# EasyEDA Pro project Switch_Robot_Carrier_V05.epro

# Schematic Schematic1
Assembly Variant: Basic; Board Name: Board1; Create Date: 2026-11-12; Page Name: P1; Project Name: Switch Robot Carrier V0.5; Schematic Name: Schematic1; Update Date: 2026-11-12; Company: 嘉立创EDA; Page Size: A4; Version: V1.0
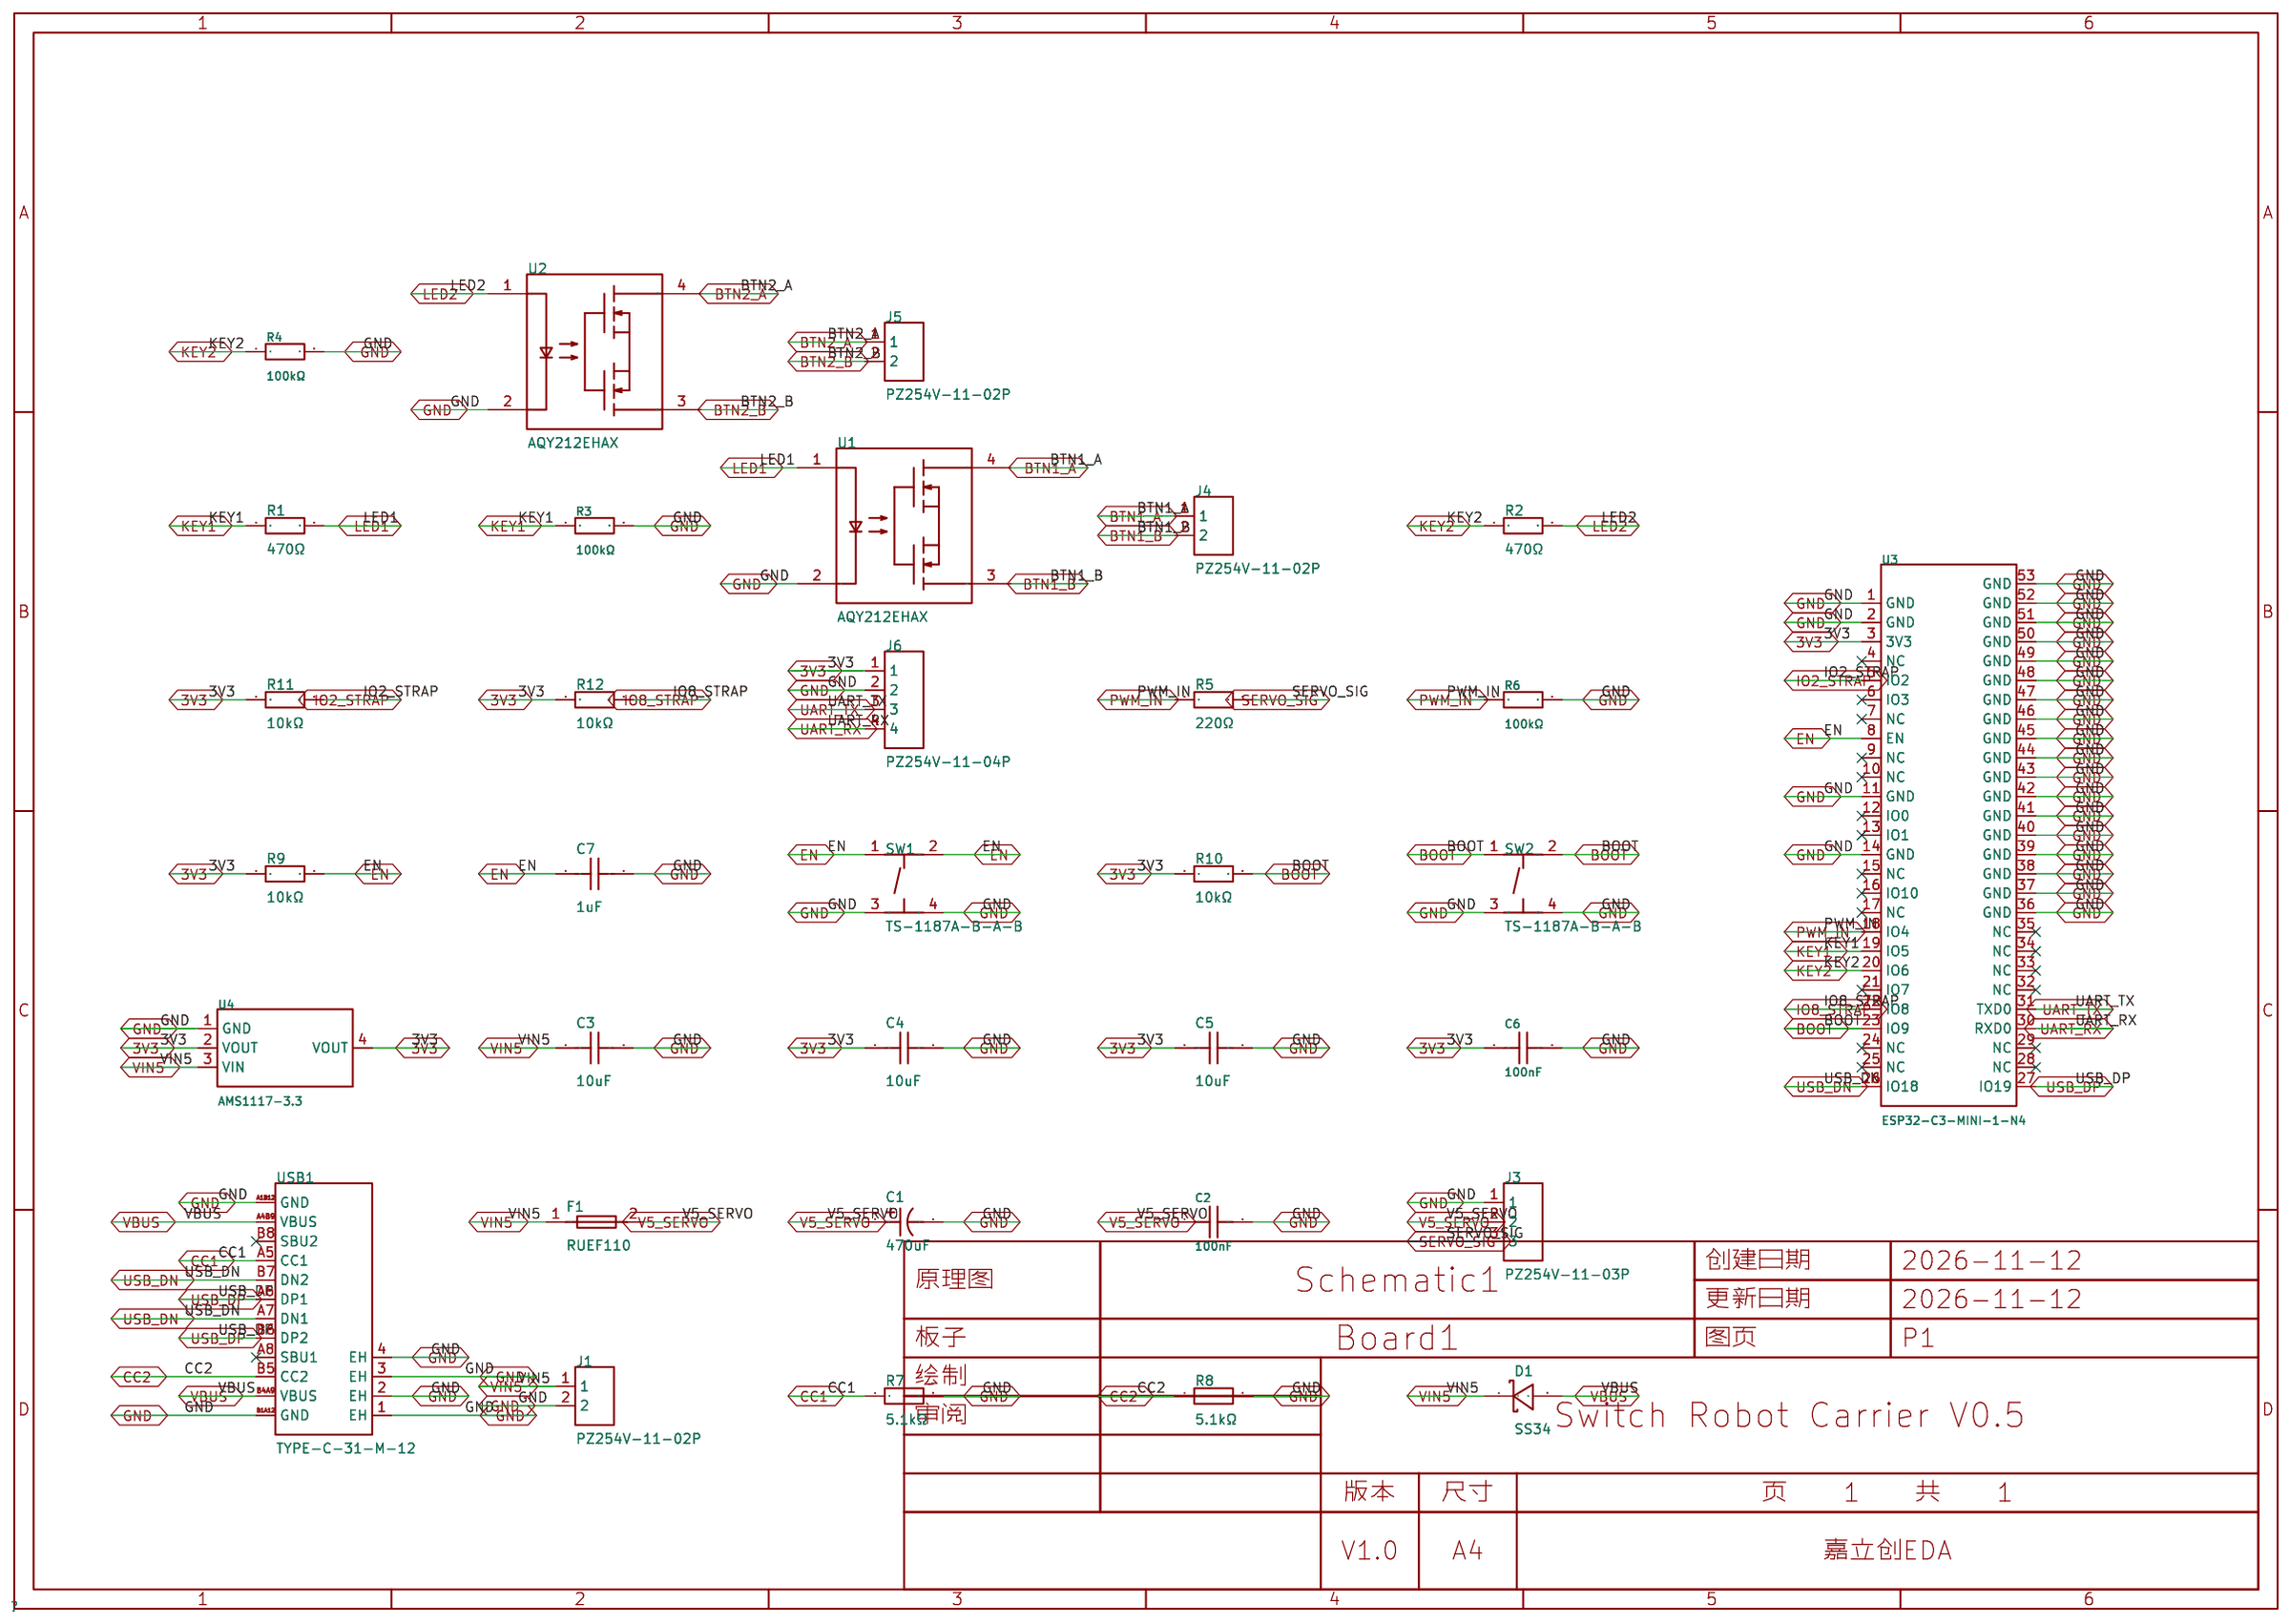
[diagram p0: schematic sheet]

## Parts
C1  470uF  [CAP-TH_BD10.0-P5.00-D0.6-FD]
C2  100nF  [C0603]
C3  10uF  [C0805]
C4  10uF  [C0805]
C5  10uF  [C0805]
C6  100nF  [C0603]
C7  1uF  [C0603]
D1  SS34  [SMA_L4.3-W2.6-LS5.2-RD]
F1  RUEF110  [FUSE-TH_L7.0-W3.1-P5.08-D1.2]
J1  PZ254V-11-02P  [HDR-TH_2P-P2.54-V-M]
J3  PZ254V-11-03P  [HDR-TH_3P-P2.54-V-M_PZ254V-11-03P]
J4  PZ254V-11-02P  [HDR-TH_2P-P2.54-V-M]
J5  PZ254V-11-02P  [HDR-TH_2P-P2.54-V-M]
J6  PZ254V-11-04P  [HDR-TH_4P-P2.54-V-M]
R1  470Ω  [R0603]
R2  470Ω  [R0603]
R3  100kΩ  [R0603]
R4  100kΩ  [R0603]
R5  220Ω  [R0603]
R6  100kΩ  [R0603]
R7  5.1kΩ  [R0603]
R8  5.1kΩ  [R0603]
R9  10kΩ  [R0603]
R10  10kΩ  [R0603]
R11  10kΩ  [R0603]
R12  10kΩ  [R0603]
SW1  TS-1187A-B-A-B  [SW-SMD_4P-L5.1-W5.1-P3.70-LS6.5-TL_H1.5]
SW2  TS-1187A-B-A-B  [SW-SMD_4P-L5.1-W5.1-P3.70-LS6.5-TL_H1.5]
U1  AQY212EHAX  [SOP-4_L6.5-W4.6-P2.54-LS10.2-TR]
U2  AQY212EHAX  [SOP-4_L6.5-W4.6-P2.54-LS10.2-TR]
U3  ESP32-C3-MINI-1-N4  [WIFIM-SMD_ESP32-C3-MINI-1]
U4  AMS1117-3.3  [SOT-223-3_L6.5-W3.4-P2.30-LS7.0-BR]
USB1  TYPE-C-31-M-12  [USB-C_SMD-TYPE-C-31-M-12_1]

## Library data of the parts
C1 = EEUFR1E471B: 容值:470uF;精度:±20%;额定电压:25V;纹波电流:967.5mA@120Hz;等效串联电阻(ESR):-;; LCSC Part Name: 470uF ±20% 25V; Supplier Part: C713400; Manufacturer: PANASONIC(松下); Supplier Footprint: 插件,D10xL12.5mm; JLCPCB Part Class: Extended Part; Datasheet: https://item.szlcsc.com/datasheet/EEUFR1E471B/753608.html; Supplier: LCSC; Tolerance: ±20%; Voltage Rating: 25V; Ripple Current: 967.5mA@120Hz; Pin Spacing: 5mm; Diameter: 10mm; Height - Seated (Max): 14mm; Lifetime: 6000hrs@105℃; Operating Temperature: -40℃~+105℃; Polarity type: 有极性; PCB Layer: Default
C2 C6 = CC0603KRX7R9BB104: 容值:100nF;精度:±10%;额定电压:50V;温度系数:X7R;; LCSC Part Name: 100nF ±10% 50V; Supplier Part: C14663; Manufacturer: YAGEO(国巨); Supplier Footprint: 0603; JLCPCB Part Class: Basic Part; Datasheet: https://item.szlcsc.com/datasheet/CC0603KRX7R9BB104/15331.html; Supplier: LCSC; Tolerance: ±10%; Voltage Rating: 50V; Temperature Coefficient: X7R; PCB Layer: Default
C3-C5 = CL21A106KAYNNNE_C15850: 容值:10uF;精度:±10%;额定电压:25V;温度系数:X5R;; LCSC Part Name: 10uF ±10% 25V; Supplier Part: C15850; Manufacturer: SAMSUNG(三星); Manufacturer Part: CL21A106KAYNNNE; Supplier Footprint: 0805; JLCPCB Part Class: Basic Part; Datasheet: https://item.szlcsc.com/datasheet/CL21A106KAYNNNE/16532.html; Supplier: LCSC; Tolerance: ±10%; Voltage Rating: 25V; Temperature Coefficient: X5R; PCB Layer: Default
C7 = CL10A105KB8NNNC: 容值:1uF;精度:±10%;额定电压:50V;温度系数:X5R;; LCSC Part Name: 1uF ±10% 50V; Supplier Part: C15849; Manufacturer: SAMSUNG(三星); Supplier Footprint: 0603; JLCPCB Part Class: Basic Part; Datasheet: https://item.szlcsc.com/datasheet/CL10A105KB8NNNC/16531.html; Supplier: LCSC; Tolerance: ±10%; Voltage Rating: 50V; Temperature Coefficient: X5R; PCB Layer: Default
D1 = SS34_C8678: 二极管配置:独立式;正向压降(Vf):550mV@3A;直流反向耐压(Vr):40V;整流电流:3A;; LCSC Part Name: 电压:40V 电流:3A; Supplier Part: C8678; Manufacturer: MDD(辰达半导体); Supplier Footprint: SMA(DO-214AC); JLCPCB Part Class: Basic Part; Datasheet: https://item.szlcsc.com/datasheet/SS34/9178.html; Supplier: LCSC; Diode Configuration: 独立式; Voltage - Forward(Vf@If): 550mV@3A; Voltage - DC Reverse(Vr): 40V; Current - Rectified: 3A; Reverse Leakage Current (Ir): 500uA@40V; Operating Junction Temperature Range: -55℃~+125℃; Non-Repetitive Peak Forward Surge Current: 80A; PCB Layer: Default
F1 = RUEF110: 耐压(Vmax):30V;最大电流(Imax):100A;保持电流(Ihold):1.1A;跳闸电流(Itrip):2.2A;; LCSC Part Name: 30V 1.1A 插件自恢复; Supplier Part: C5395; Manufacturer: Littelfuse(美国力特); Supplier Footprint: 插件,P=5.08mm; JLCPCB Part Class: Extended Part; Datasheet: https://item.szlcsc.com/datasheet/RUEF110/5832.html; Supplier: LCSC; Voltage - Max: 30V; Current - Max: 100A; Hold Current: 1.1A; Trip Current: 2.2A; Power Dissipation: 1.17W; Resistance - Initial (Ri) (Min): 70mΩ; Resistance - Post Trip (R1) (Max): 170mΩ; Time to Trip(Max): 6.6s; PCB Layer: Default
J1 J4 J5 = PZ254V-11-02P: 插针结构:1x2P;间距:2.54mm;行距:-;圆针/方针:方针;安装方式:直插;排数:单排;总PIN位数:2P;额定电流:3A;额定电压:250V;配合针长度:6.1mm;塑高:2.5mm;端接针长度:3mm;触头材质:黄铜;触头镀层:金;工作温度:-40℃~+105℃;颜色:黑色;; LCSC Part Name: 1x2P 间距:2.54mm 方针 直插; Supplier Part: C492401; Manufacturer: XFCN(兴飞); Supplier Footprint: 插件,P=2.54mm; JLCPCB Part Class: Extended Part; Datasheet: https://item.szlcsc.com/datasheet/PZ254V-11-02P/502957.html; Supplier: LCSC; Pin Structure: 1x2P; Pitch: 2.54mm; Circluar Pins/Square Pins: 方针; Mounting Type: 直插; Number of Rows: 单排; Number of Pins: 2P; Current Rating: 3A; Voltage Rating (Max): 250V; Length of Mating Pin: 6.1mm; Insulation Height: 2.5mm; Length of End Connection Pin: 3mm; Contact Material: 黄铜; Contact Plating: 金; Operating Temperature: -40℃~+105℃; Color: 黑色; PCB Layer: Default
J3 = PZ254V-11-03P: 插针结构:1x3P;间距:2.54mm;行距:-;圆针/方针:方针;安装方式:直插;排数:单排;总PIN位数:3P;额定电流:3A;额定电压:250V;配合针长度:6.1mm;塑高:2.5mm;端接针长度:3mm;触头材质:黄铜;触头镀层:金;工作温度:-40℃~+105℃;颜色:黑色;; LCSC Part Name: 1x3P 间距:2.54mm 方针 直插; Supplier Part: C2937625; Manufacturer: XFCN(兴飞); Supplier Footprint: 插件,P=2.54mm; JLCPCB Part Class: Extended Part; Datasheet: https://item.szlcsc.com/datasheet/PZ254V-11-03P/3293280.html; Supplier: LCSC; Pin Structure: 1x3P; Pitch: 2.54mm; Circluar Pins/Square Pins: 方针; Mounting Type: 直插; Number of Rows: 单排; Number of Pins: 3P; Current Rating: 3A; Voltage Rating (Max): 250V; Length of Mating Pin: 6.1mm; Insulation Height: 2.5mm; Length of End Connection Pin: 3mm; Contact Material: 黄铜; Contact Plating: 金; Operating Temperature: -40℃~+105℃; Color: 黑色; PCB Layer: Default
J6 = PZ254V-11-04P_C492403: 插针结构:1x4P;间距:2.54mm;行距:-;圆针/方针:方针;安装方式:直插;排数:单排;总PIN位数:4P;额定电流:3A;额定电压:250V;配合针长度:6.1mm;塑高:2.5mm;端接针长度:3mm;触头材质:黄铜;触头镀层:金;工作温度:-40℃~+105℃;颜色:黑色;; LCSC Part Name: 1x4P 间距:2.54mm 方针 直插; Supplier Part: C492403; Manufacturer: XFCN(兴飞); Supplier Footprint: 插件,P=2.54mm; JLCPCB Part Class: Extended Part; Datasheet: https://item.szlcsc.com/datasheet/PZ254V-11-04P/502959.html; Supplier: LCSC; Pin Structure: 1x4P; Pitch: 2.54mm; Circluar Pins/Square Pins: 方针; Mounting Type: 直插; Number of Rows: 单排; Number of Pins: 4P; Current Rating: 3A; Voltage Rating (Max): 250V; Length of Mating Pin: 6.1mm; Insulation Height: 2.5mm; Length of End Connection Pin: 3mm; Contact Material: 黄铜; Contact Plating: 金; Operating Temperature: -40℃~+105℃; Color: 黑色; PCB Layer: Default
R1 R2 = 0603WAF4700T5E: 电阻类型:厚膜电阻;阻值:470Ω;精度:±1%;功率:100mW;工作电压:75V;温度系数:±100ppm/℃;; LCSC Part Name: 厚膜电阻 470Ω ±1%; Supplier Part: C23179; Manufacturer: UNI-ROYAL(厚声); Supplier Footprint: 0603; JLCPCB Part Class: Basic Part; Datasheet: https://item.szlcsc.com/datasheet/0603WAF4700T5E/23906.html; Supplier: LCSC; Type: 厚膜电阻; Tolerance: ±1%; Power(Watts): 100mW; Voltage-Supply(Max): 75V; Temperature Coefficient: ±100ppm/℃; Operating Temperature: -55℃~+155℃; PCB Layer: Default
R3 R4 R6 = 0603WAF1003T5E: 电阻类型:厚膜电阻;阻值:100kΩ;精度:±1%;功率:100mW;工作电压:75V;温度系数:±100ppm/℃;; LCSC Part Name: 厚膜电阻 100kΩ ±1% 100mW; Supplier Part: C25803; Manufacturer: UNI-ROYAL(厚声); Supplier Footprint: 0603; JLCPCB Part Class: Basic Part; Datasheet: https://item.szlcsc.com/datasheet/0603WAF1003T5E/26546.html; Supplier: LCSC; Type: 厚膜电阻; Tolerance: ±1%; Power(Watts): 100mW; Voltage-Supply(Max): 75V; Temperature Coefficient: ±100ppm/℃; Operating Temperature: -55℃~+155℃; PCB Layer: Default
R5 = 0603WAF2200T5E: 电阻类型:厚膜电阻;阻值:220Ω;精度:±1%;功率:100mW;最大工作电压:75V;温度系数:±100ppm/℃;; LCSC Part Name: 220Ω ±1% 100mW 厚膜电阻; Supplier Part: C22962; Manufacturer: UNI-ROYAL(厚声); Supplier Footprint: 0603; JLCPCB Part Class: Basic Part; Datasheet: https://atta.szlcsc.com/upload/public/pdf/source/20200306/C422600_1E6D84923E4A46A82E41ADD87F860B5C.pdf; Supplier: LCSC; Type: 厚膜电阻; Tolerance: ±1%; Power(Watts): 100mW; Overload Voltage (Max): 75V; Temperature Coefficient: ±100ppm/℃; Operating Temperature Range: -55℃~+155℃; PCB Layer: Default
R7 R8 = 0603WAF5101T5E: 电阻类型:厚膜电阻;阻值:5.1kΩ;精度:±1%;功率:100mW;工作电压:75V;温度系数:±100ppm/℃;; LCSC Part Name: 厚膜电阻 5.1kΩ ±1%; Supplier Part: C23186; Manufacturer: UNI-ROYAL(厚声); Supplier Footprint: 0603; JLCPCB Part Class: Basic Part; Datasheet: https://item.szlcsc.com/datasheet/0603WAF5101T5E/23913.html; Supplier: LCSC; Type: 厚膜电阻; Tolerance: ±1%; Power(Watts): 100mW; Voltage-Supply(Max): 75V; Temperature Coefficient: ±100ppm/℃; Operating Temperature: -55℃~+155℃; PCB Layer: Default
R9-R12 = 0603WAF1002T5E: 电阻类型:厚膜电阻;阻值:10kΩ;精度:±1%;功率:100mW;工作电压:75V;温度系数:±100ppm/℃;; LCSC Part Name: 厚膜电阻 10kΩ ±1% 100mW; Supplier Part: C25804; Manufacturer: UNI-ROYAL(厚声); Supplier Footprint: 0603; JLCPCB Part Class: Basic Part; Datasheet: https://item.szlcsc.com/datasheet/0603WAF1002T5E/26547.html; Supplier: LCSC; Type: 厚膜电阻; Tolerance: ±1%; Power(Watts): 100mW; Voltage-Supply(Max): 75V; Temperature Coefficient: ±100ppm/℃; Operating Temperature: -55℃~+155℃; PCB Layer: Default
SW1 SW2 = TS-1187A-B-A-B: 电路结构:单刀单掷;按钮形状:圆形按钮;作用力:1.6N;安装方式:立贴;开关长度:5.1mm;开关宽度:5.1mm;开关高度:1.5mm;带支架:不带支架;触点电流:50mA;额定电压:12V;带灯:无;工作寿命:10万次;; LCSC Part Name: 5.1*5.1*1.5mm 立贴 轻触开关; Supplier Part: C318884; Manufacturer: XKB Connection(中国星坤); Supplier Footprint: SMD-4P,5.1x5.1mm; JLCPCB Part Class: Basic Part; Datasheet: https://item.szlcsc.com/datasheet/TS-1187A-B-A-B/299976.html; Supplier: LCSC; Circuit: 单刀单掷; Actuator Style: 圆形按钮; Operating Force: 1.6N; Mounting Type: 立贴; Length: 5.1mm; Width: 5.1mm; Switch Height: 1.5mm; with Bracket: 不带支架; Contact Current: 50mA; Voltage Rating: 12V; Actuator/Cap Color: 金色; With Lamp: 无; Life: 10万次; Operating Temperature: -30℃~+85℃; PCB Layer: Default
U1 U2 = AQY212EHAX: 触点形式:SPST-NO(1 Form A);负载类型:-;正向压降(Vf):1.25V;负载电压:60V;连续负载电流:550mA;导通电阻:850mΩ;; LCSC Part Name: 1 Form A(SPSTNO) 负载AC,DC 负载电压60V; Supplier Part: C29276; Manufacturer: PANASONIC(松下); Supplier Footprint: SOP-4-2.54mm; JLCPCB Part Class: Extended Part; Datasheet: https://item.szlcsc.com/datasheet/AQY212EHAX/30028.html; Supplier: LCSC; Contact Form: SPST-NO(1 Form A); Voltage - Forward(Vf): 1.25V; Load Voltage: 60V; Load Current: 550mA; RDS(on): 850mΩ; Isolation Voltage(Vrms): 5kV; Turn-on time: 1ms; Turn-off time: 50us; PCB Layer: Default
U3 = ESP32-C3-MINI-1-N4: SMD module, ESP32-C3FN4, PCB antenna, -40?C ~ +85?C; LCSC Part Name: 不带固件 支持2.4GHz Wi-Fi和蓝牙5的小尺寸模组; Supplier Part: C2838502; Manufacturer: ESPRESSIF(乐鑫); Supplier Footprint: SMD,16.6x13.2mm; JLCPCB Part Class: Extended Part; Datasheet: https://item.szlcsc.com/datasheet/ESP32-C3-MINI-1-N4/3013227.html; Supplier: LCSC; PCB Layer: Default
U4 = AMS1117-3.3_C6186: 输出极性:正极;工作电压:15V;输出电压:3.3V;输出电流:1A;电源纹波抑制比(PSRR):72dB@(120Hz);输出类型:固定;; LCSC Part Name: 3.3V 1A 15V; Supplier Part: C6186; Manufacturer: Advanced Monolithic Systems; Supplier Footprint: SOT-223; JLCPCB Part Class: Basic Part; Datasheet: https://item.szlcsc.com/datasheet/AMS1117-3.3/6652.html; Supplier: LCSC; Output Configuration: 正极; Voltage - Supply: 15V; Output Voltage: 3.3V; Output Current: 1A; Power Supply Rejection Ratio (PSRR): 72dB@(120Hz); Voltage Dropout: 1.1V@(800mA); standby current: 5mA; Noise: 0.003%Vout; Features: 短路保护；热关断；过流保护; Operating Temperature: -40℃~+125℃; Output Type: 固定; Number of Outputs: 1; PCB Layer: Default
USB1 = TYPE-C-31-M-12: 连接器类型:Type-C;协议标准:-;公母:母;安装方式:卧贴;触点数量:16P;端口数量:1;额定电流 - 电源:5A;工作温度:-30℃~+80℃;; LCSC Part Name: Type-C 母 卧贴; Supplier Part: C165948; Manufacturer: 韩国韩荣; Supplier Footprint: SMD; JLCPCB Part Class: Extended Part; Datasheet: https://item.szlcsc.com/datasheet/TYPE-C-31-M-12/177331.html; Supplier: LCSC; Connector Type: Type-C; Gender: 母; Mounting Type: 卧贴; Number of Contacts: 16P; Number of Ports: 1; Current Rating-Power: 5A; Voltage Rating: 20V; Connect-Disconnect Life: 1万次; Length: 7.35mm; Operating Temperature: -30℃~+80℃; PCB Layer: Default

## Nets
3V3: C4.1 C5.1 C6.1 J6.1 R9.1 R10.1 R11.1 R12.1 U3.3(3V3) U4.2(VOUT) U4.4(VOUT)
GND: C1.2 C2.2 C3.2 C4.2 C5.2 C6.2 C7.2 J1.2 J3.1 J6.2 R3.2 R4.2 R6.2 R7.2 R8.2 SW1.3(C) SW1.4(D) SW2.3(C) SW2.4(D) U1.2(K) U2.2(K) U3.1(GND) U3.2(GND) U3.11(GND) U3.14(GND) U3.36(GND) U3.37(GND) U3.38(GND) U3.39(GND) U3.40(GND) U3.41(GND) U3.42(GND) U3.43(GND) U3.44(GND) U3.45(GND) U3.46(GND) U3.47(GND) U3.48(GND) U3.49(GND) U3.50(GND) U3.51(GND) U3.52(GND) U3.53(GND) U4.1(GND) USB1.1(EH) USB1.2(EH) USB1.3(EH) USB1.4(EH) USB1.A1B12(GND) USB1.B1A12(GND)
V5_SERVO: C1.1 C2.1 F1.2 J3.2
VBUS: D1.2(A) USB1.A4B9(VBUS) USB1.B4A9(VBUS)
VIN5: C3.1 D1.1(K) F1.1 J1.1 U4.3(VIN)
BOOT: R10.2 SW2.1(A) SW2.2(B) U3.23(IO9)
BTN1_A: J4.1 U1.4(S)
BTN1_B: J4.2 U1.3(S1)
BTN2_A: J5.1 U2.4(S)
BTN2_B: J5.2 U2.3(S1)
CC1: R7.1 USB1.A5(CC1)
CC2: R8.1 USB1.B5(CC2)
EN: C7.1 R9.2 SW1.1(A) SW1.2(B) U3.8(EN)
IO2_STRAP: R11.2 U3.5(IO2)
IO8_STRAP: R12.2 U3.22(IO8)
KEY1: R1.1 R3.1 U3.19(IO5)
KEY2: R2.1 R4.1 U3.20(IO6)
LED1: R1.2 U1.1(A)
LED2: R2.2 U2.1(A)
PWM_IN: R5.1 R6.1 U3.18(IO4)
SERVO_SIG: J3.3 R5.2
UART_RX: J6.4 U3.30(RXD0)
UART_TX: J6.3 U3.31(TXD0)
USB_DN: U3.26(IO18) USB1.A7(DN1) USB1.B7(DN2)
USB_DP: U3.27(IO19) USB1.A6(DP1) USB1.B6(DP2)

Not connected (* = marked no-connect by the designer): U3 4(NC)* 6(IO3)* 7(NC)* 9(NC)* 10(NC)* 12(IO0)* 13(IO1)* 15(NC)* 16(IO10)* 17(NC)* 21(IO7)* 24(NC)* 25(NC)* 28(NC)* 29(NC)* 32(NC)* 33(NC)* 34(NC)* 35(NC)*; USB1 A8(SBU1)* B8(SBU2)*

# Board PCB1
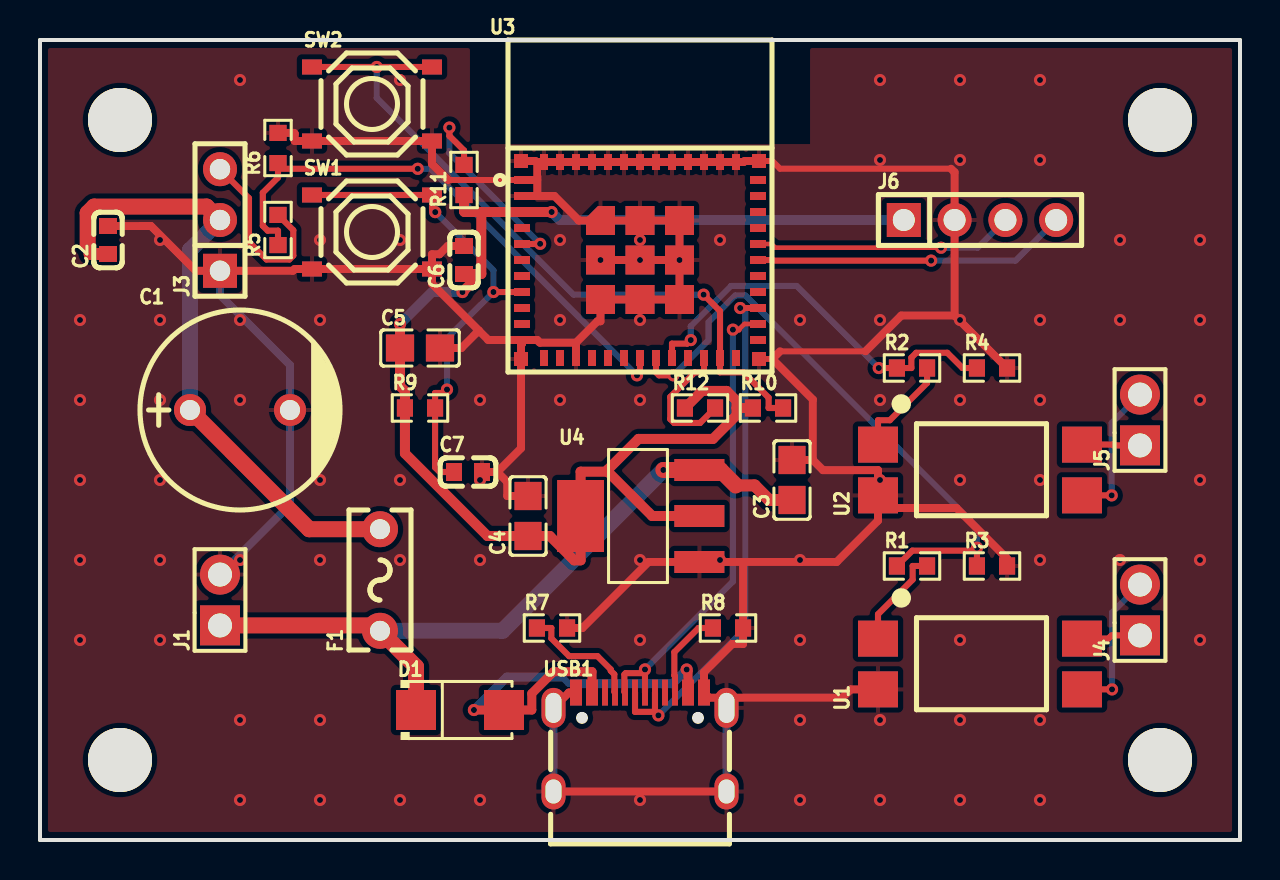
[diagram p1: board, top side]
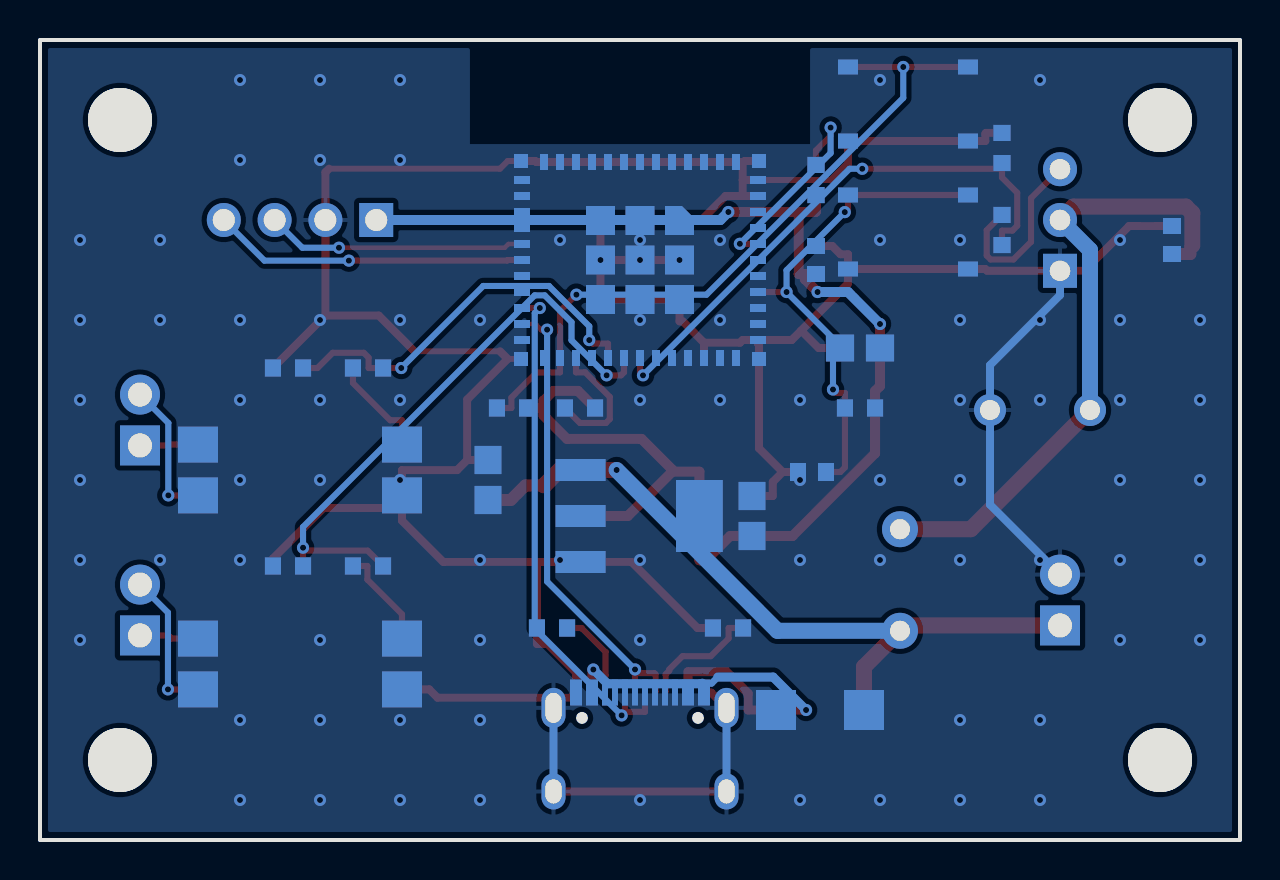
[diagram p2: board, bottom side, seen from below]

Outline 60 x 40 mm; copper layers: Top Layer, Bottom Layer. Coordinates in mm from the lower left corner of the outline.
Outline path: 0,40 60,40 60,0 0,0 0,40
Stack: Top Layer 0.035mm / Dielectric1 1.51mm FR4 er 4.5 / Bottom Layer 0.035mm

## Design rules (mm)
spacing copperThickness1oz (default): track to track 0.102, other pairs 0.152 to 0.3
spacing copperThickness2oz: track to track 0.203, other pairs 0.152 to 0.3
track width copperThickness1oz (default): min 0.127, default 0.254, max 2.54
track width copperThickness2oz: min 0.203, default 0.254, max 2.54
differential pair differentialPair (default): width min 0.127, default 0.254, max 2.54; gap min 0.152, default 0.152

## Placement (name value [footprint] x y rotation side)
C1  470uF  [CAP-TH_BD10.0-P5.00-D0.6-FD]  10 21.5 0 top
C2  100nF  [C0603]  3.4 30 90 top
C3  10uF  [C0805]  37.6 18 90 top
C4  10uF  [C0805]  24.4 16.2 90 top
C5  10uF  [C0805]  19 24.6 0 top
C6  100nF  [C0603]  21.2 29 90 top
C7  1uF  [C0603]  21.4 18.4 0 top
D1  SS34  [SMA_L4.3-W2.6-LS5.2-RD]  21 6.5 0 top
F1  RUEF110  [FUSE-TH_L7.0-W3.1-P5.08-D1.2]  17 13 90 top
J1  PZ254V-11-02P  [HDR-TH_2P-P2.54-V-M]  9 12 90 top
J3  PZ254V-11-03P  [HDR-TH_3P-P2.54-V-M_PZ254V-11-03P]  9 31 90 top
J4  PZ254V-11-02P  [HDR-TH_2P-P2.54-V-M]  55 11.5 90 top
J5  PZ254V-11-02P  [HDR-TH_2P-P2.54-V-M]  55 21 90 top
J6  PZ254V-11-04P  [HDR-TH_4P-P2.54-V-M]  47 31 0 top
NOREF  -  [Pad_e5]  4 36 0 top
NOREF#2  -  [Pad_e3]  56 4 0 top
NOREF#3  -  [Pad_e2]  4 4 0 top
NOREF#4  -  [Pad_e4]  56 36 0 top
R1  470Ω  [R0603]  43.6 13.7 0 top
R2  470Ω  [R0603]  43.6 23.6 0 top
R3  100kΩ  [R0603]  47.6 13.7 0 top
R4  100kΩ  [R0603]  47.6 23.6 0 top
R5  220Ω  [R0603]  11.9 30.5 90 top
R6  100kΩ  [R0603]  11.9 34.6 90 top
R7  5.1kΩ  [R0603]  25.6 10.6 0 top
R8  5.1kΩ  [R0603]  34.4 10.6 0 top
R9  10kΩ  [R0603]  19 21.6 0 top
R10  10kΩ  [R0603]  36.4 21.6 0 top
R11  10kΩ  [R0603]  21.2 33 90 top
R12  10kΩ  [R0603]  33 21.6 0 top
SW1  TS-1187A-B-A-B  [SW-SMD_4P-L5.1-W5.1-P3.70-LS6.5-TL_H1.5]  16.6 30.4 0 top
SW2  TS-1187A-B-A-B  [SW-SMD_4P-L5.1-W5.1-P3.70-LS6.5-TL_H1.5]  16.6 36.8 0 top
U1  AQY212EHAX  [SOP-4_L6.5-W4.6-P2.54-LS10.2-TR]  47 8.8 90 top
U2  AQY212EHAX  [SOP-4_L6.5-W4.6-P2.54-LS10.2-TR]  47 18.5 90 top
U3  ESP32-C3-MINI-1-N4  [WIFIM-SMD_ESP32-C3-MINI-1]  30 29 0 top
U4  AMS1117-3.3  [SOT-223-3_L6.5-W3.4-P2.30-LS7.0-BR]  30 16.2 0 top
USB1  TYPE-C-31-M-12  [USB-C_SMD-TYPE-C-31-M-12_1]  30 4.9 0 top

## Footprints (pads in the part's own frame, mm; a bottom-side part is the same pattern mirrored in y, then rotated)
C0603
  rect 0.8x0.9 hole 0.001: 1(-0.7,0) 2(0.7,0)
C0805
  rect 1.41x1.35 hole 0.001: 1(-1,0) 2(1,0)
CAP-TH_BD10.0-P5.00-D0.6-FD
  round 1.6 hole 1: 1(-2.5,0) 2(2.5,0)
FUSE-TH_L7.0-W3.1-P5.08-D1.2
  round 1.8 hole 1: 1(-2.54,0) 2(2.54,0)
HDR-TH_2P-P2.54-V-M
  rect 2x2 hole 1.2: 1(-1.27,0)
  round 2 hole 1.2: 2(1.27,0)
HDR-TH_3P-P2.54-V-M_PZ254V-11-03P
  rect 1.7x1.7 hole 1.02: 1(-2.54,0)
  round 1.7 hole 1.02: 2(0,0) 3(2.54,0)
HDR-TH_4P-P2.54-V-M
  rect 1.7x1.7 hole 1.1: 1(-3.81,0)
  round 1.7 hole 1.1: 2(-1.27,0) 3(1.27,0) 4(3.81,0)
Pad_e2
  round 3.2 hole 3.2: (0,0)
Pad_e3
  round 3.2 hole 3.2: (0,0)
Pad_e4
  round 3.2 hole 3.2: (0,0)
Pad_e5
  round 3.2 hole 3.2: (0,0)
R0603
  rect 0.806x0.864 hole 0.001: 1(-0.753,0) 2(0.753,0)
SMA_L4.3-W2.6-LS5.2-RD
  rect 2x2 hole 0.001: 1(-2.2,0) 2(2.2,0)
SOP-4_L6.5-W4.6-P2.54-LS10.2-TR
  rect 1.8x2 hole 0.001: 1(1.27,5.1) 2(-1.27,5.1) 3(-1.27,-5.1) 4(1.27,-5.1)
SOT-223-3_L6.5-W3.4-P2.30-LS7.0-BR
  rect 2.5x1.1 hole 0.001: 1(2.97,-2.3) 2(2.97,0) 3(2.97,2.3)
  rect 2.34x3.6 hole 0.001: 4(-2.97,0)
SW-SMD_4P-L5.1-W5.1-P3.70-LS6.5-TL_H1.5
  rect 1x0.75 hole 0.001: 1(-3,1.85) 2(3,1.85) 3(-3,-1.85) 4(3,-1.85)
USB-C_SMD-TYPE-C-31-M-12_1
  oval 1.2x2 hole 0.8x1.5: 1(4.325,1.706) 4(-4.325,1.706)
  oval 1.2x1.8 hole 0.8x1.2: 2(4.325,-2.474) 3(-4.325,-2.474)
  custom 0.6x1.3 hole 0.001: A1B12(-3.2,2.474) A4B9(-2.4,2.474) B1A12(3.2,2.474) B4A9(2.401,2.474)
  rect 0.3x1.3 hole 0.001: A5(-1.25,2.474) A6(-0.25,2.474) A7(0.25,2.474) A8(1.25,2.474) B5(1.75,2.474) B6(0.75,2.474) B7(-0.75,2.474) B8(-1.75,2.474)
WIFIM-SMD_ESP32-C3-MINI-1
  rect 0.8x0.4 hole 0.001: 1(-5.9,4) 2(-5.9,3.2) 3(-5.9,2.4) 4(-5.9,1.6) 5(-5.9,0.8) 6(-5.9,0) 7(-5.9,-0.8) 8(-5.9,-1.6) 9(-5.9,-2.4) 10(-5.9,-3.2) 11(-5.9,-4) 25(5.9,-4) 26(5.9,-3.2) 27(5.9,-2.4) 28(5.9,-1.6) 29(5.9,-0.8) 30(5.9,0) 31(5.9,0.8) 32(5.9,1.6) 33(5.9,2.4) 34(5.9,3.2) 35(5.9,4)
  rect 0.4x0.8 hole 0.001: 12(-4.8,-4.9) 13(-4,-4.9) 14(-3.2,-4.9) 15(-2.4,-4.9) 16(-1.6,-4.9) 17(-0.8,-4.9) 18(0,-4.9) 19(0.8,-4.9) 20(1.6,-4.9) 21(2.4,-4.9) 22(3.2,-4.9) 23(4,-4.9) 24(4.8,-4.9) 36(4.8,4.9) 37(4,4.9) 38(3.2,4.9) 39(2.4,4.9) 40(1.6,4.9) 41(0.8,4.9) 42(0,4.9) 43(-0.8,4.9) 44(-1.6,4.9) 45(-2.4,4.9) 46(-3.2,4.9) 47(-4,4.9) 48(-4.8,4.9)
  custom 1.45x1.45 hole 0.001: 49(-1.975,1.975)
  rect 1.45x1.45 hole 0.001: 49(-1.975,0) 49(-1.975,-1.975) 49(0,1.975) 49(0,0) 49(0,-1.975) 49(1.975,1.975) 49(1.975,0) 49(1.975,-1.975)
  rect 0.7x0.7 hole 0.001: 50(5.95,4.95) 51(5.95,-4.95) 52(-5.95,-4.95) 53(-5.95,4.95)

## Nets
As in the schematic.

Pads without a net: U3 4 6 7 9 10 12 13 15 16 17 21 24 25 28 29 32 33 34 35; USB1 A8 B8

## Via types
v1: diameter 0.6, hole 0.3, Top Layer to Bottom Layer, 84 vias
v2: diameter 0.61, hole 0.305, Top Layer to Bottom Layer, 27 vias

## Routing (per net, layer and track width the routed paths; a pad name or vN(x,y) marks a point on that pad's centre or on a via; arc(x,y) is an arc through that point)
3V3: length 73.1
  Top Layer w0.5: v2(21.12,27.4) 21.76,28.03 21.76,28.3 ; v2(25.58,31.4) U3.3 22.06,31.4 ; 32.25,21.6 33.1,22.45 34.33,22.45 34.83,21.96 34.83,21.6 ; 21.76,28.3 22.06,28.3 22.06,31.4 ; 21.76,28.3 21.2,28.3 ; v2(18,25.8) C5.1 18,22.69 18.25,22.45 18.25,19.33 22.38,15.2 C4.1 25.49,15.2 26.71,13.98 27.03,13.98 U4.4 27.03,18.42 28.39,18.42 ; 34.83,21.6 34.83,21.24 33.65,20.05 29.92,20.05 28.39,18.52 28.39,18.42 ; 34.83,21.6 R10.1 ; 28.39,18.42 30.61,16.2 32.97,16.2 ; 21.2,32.25 21.2,31.43 21.23,31.4 22.06,31.4
  Bottom Layer w0.5: v2(21.12,27.4) 19.6,27.4 v2(18,25.8) ; J6.1 25.98,31 v2(25.58,31.4)
GND: length 217.5
  Top Layer w0.299: 35.95,24.05 36.61,24.05 ; U3.1 20.4,33 ; 41.28,24.44 37,24.44 ; 45.55,33.56 37,33.56 36.61,33.95 35.95,33.95
  Top Layer w0.399: 21.94,25.47 21.07,24.6 C5.2 ; 21.94,25.47 19.6,27.81 SW1.4 ; 21.94,25.47 22.41,25 U3.11 ; 24.86,33.9 24.82,33.9 24.76,33.95 24.05,33.95 ; 24.86,33.9 U3.48 U3.47 U3.46 U3.45 U3.44 U3.43 U3.42 U3.41 U3.40 U3.39 U3.38 U3.37 U3.36 35.18,33.9 35.24,33.95 35.95,33.95 ; 24.86,33.9 24.86,33 ; 34.33,6.61 34.33,7.11 ; 34.33,7.11 33.46,7.11 USB1.B1A12 33.2,8.39 34.62,9.8 35.15,9.8 R8.2 35.15,13.9 ; 34.33,7.11 40.12,7.11 40.54,7.53 41.9,7.53 ; 24.86,32.2 24.86,33 ; 24.86,32.2 U3.2 ; 24.86,32.2 25.72,32.2 26.93,30.99 26.93,30.98 U3.49 U3.49 U3.49 v1(31.98,29) ; 24.86,33 U3.1 ; 41.9,16.6 41.9,18.49 39.15,18.49 38.64,19 ; 41.9,16.6 41.9,15.97 39.84,13.9 35.15,13.9 ; 41.9,16.6 45.82,16.6 48.35,14.07 R3.2 ; 37,24.44 36.61,24.05 38.64,22.02 38.64,19 ; 38.64,19 C3.2 ; 45.73,26.22 J6.2 45.73,33.39 45.55,33.56 ; 45.73,26.22 R4.2 ; 45.73,26.22 43.06,26.22 41.28,24.44 ; v1(31.98,29) 31.98,27.03 28.02,27.03 28.02,25.94 27.87,25.94 26.8,24.86 ; v1(31.98,29) v1(30,29) v1(28.02,29) ; U3.11 24.1,24.82 24.05,24.77 24.05,19.59 22.87,18.4 ; U3.11 24.86,25 25,24.86 26.8,24.86 ; 22.87,18.4 23.36,17.9 23.36,17.2 C4.2 ; 22.87,18.4 C7.2 ; 20.4,33 19.6,33.8 SW2.4 SW2.3 12.74,34.95 12.74,35.32 12.7,35.35 R6.2 ; C2.2 4.18,30.7 4.18,30.7 5.09,30.7 5.1,30.7 5.55,30.7 7.78,28.46 J3.1 12.64,28.46 12.74,28.55 SW1.3 SW1.4 ; 25.67,2.43 34.33,2.43 ; 35.15,13.9 30.42,13.9 27.12,10.6 26.35,10.6 ; U3.14 26.8,24.86 ; 25.67,6.61 26.44,7.37 USB1.A1B12 ; SW1.4 19.6,29.29 19.97,29.29 20.39,29.7 21.2,29.7
  Bottom Layer w0.399: J3.1 9,27.24 12.5,23.74 C1.2 12.5,16.77 9,13.27 ; 34.33,6.61 34.33,2.43 ; 25.67,2.43 25.67,6.61
  vias: v1(2,26) v1(2,22) v1(2,18) v1(2,14) v1(2,10) v1(6,30) v1(6,26) v1(6,22) v1(6,18) v1(6,14) v1(6,10) v1(10,38) v1(10,26) v1(10,22) v1(10,14) v1(10,6) v1(10,2) v1(14,30) v1(14,26) v1(14,22) v1(14,18) v1(14,14) v1(14,6) v1(14,2) v1(18,38) v1(18,30) v1(18,18) v1(18,14) v1(18,2) v1(22,22) v1(22,18) v1(22,14) v1(22,2) v1(26,30) v1(26,26) v1(26,22) v1(30,30) v1(30,26) v1(30,22) v1(30,14) v1(30,10) v1(30,2) v1(34,30) v1(34,14) v1(38,26) v1(38,14) v1(38,10) v1(38,6) v1(38,2) v1(42,38) v1(42,34) v1(42,26) v1(42,22) v1(42,18) v1(42,6) v1(42,2) v1(46,38) v1(46,34) v1(46,26) v1(46,22) v1(46,18) v1(46,10) v1(46,6) v1(46,2) v1(50,38) v1(50,34) v1(50,26) v1(50,22) v1(50,18) v1(50,14) v1(50,6) v1(50,2) v1(54,30) v1(54,26) v1(54,14) v1(58,30) v1(58,26) v1(58,22) v1(58,18) v1(58,14) v1(58,10)
V5_SERVO: length 32.1
  Top Layer w0.6: C2.1 2.48,29.3 2.48,29.63 2.39,29.74
  Top Layer w0.8: J3.2 8.33,31.67 2.71,31.67 2.39,31.35 2.39,29.74 ; C1.1 13.46,15.54 F1.2
  Bottom Layer w0.8: J3.2 7.5,29.5 C1.1
VBUS: length 21.2
  Top Layer w0.45: v2(32.33,8.52) 32.33,8.48 32.4,8.42 USB1.B4A9 ; USB1.A4B9 27.6,8.42 25.68,8.42 24.59,7.33 24.59,6.5 D1.2 v2(21.7,6.5)
  Bottom Layer w0.337: 26.88,7.84 26.42,7.84 26.11,8.15
  Bottom Layer w0.45: v2(21.7,6.5) 23.34,8.15 26.11,8.15 ; v2(32.33,8.52) 31.62,7.81 26.91,7.81 26.88,7.84
VIN5: length 37.4
  Top Layer w0.6: 34.79,17.73 35.73,17.73 36.46,17 C3.1
  Top Layer w0.8: 34.79,17.73 34.02,18.5 v2(31.17,18.5) ; D1.1 18.8,8.66 F1.1 16.73,10.73 9,10.73
  Bottom Layer w0.8: F1.1 23.13,10.46 v2(31.17,18.5)
BOOT: length 36.4
  Top Layer w0.305: v2(33.18,27.27) 34,26.45 U3.23 34,23.38 35.17,23.38 36.43,22.12 36.43,21.6 37.15,21.6 ; 13.6,38.65 v2(16.84,38.65) 19.6,38.65
  Bottom Layer w0.305: v2(33.18,27.27) 26.68,27.27 16.84,37.1 v2(16.84,38.65)
BTN1_A: length 3
  Top Layer w0.305: 55,10.23 53.58,10.23 53.42,10.07 52.1,10.07
BTN1_B: length 7.3
  Top Layer w0.305: v2(53.6,7.53) 52.1,7.53
  Bottom Layer w0.305: 55,12.77 53.6,11.37 v2(53.6,7.53)
BTN2_A: length 2.9
  Top Layer w0.305: J5.1 53.68,19.73 53.64,19.77 52.1,19.77
BTN2_B: length 7.1
  Top Layer w0.305: v2(53.58,17.23) 52.1,17.23
  Bottom Layer w0.305: v2(53.58,17.23) 53.58,20.85 J5.2
CC1: length 6.1
  Top Layer w0.3: USB1.A5 28.72,7.41 28.72,8.28
  Top Layer w0.305: 28.72,8.28 28.54,8.46 28.54,8.53 27.87,9.19 26.46,9.19 25.57,10.08 25.57,10.6 R7.1
CC2: length 4.5
  Top Layer w0.305: USB1.B5 31.75,8.19 31.72,8.22 31.72,9.39 32.93,10.6 33.65,10.6
EN: length 24.8
  Top Layer w0.305: SW1.1 SW1.2 19.6,31.56 v2(19.76,31.39) ; v2(22.67,27.4) U3.8 ; v2(20.35,22.52) 20.18,22.35 19.75,22.35 R9.2 19.75,18.63 19.98,18.4 C7.1
  Bottom Layer w0.305: v2(19.76,31.39) 22.67,28.49 v2(22.67,27.4) 20.35,25.08 v2(20.35,22.52)
IO2_STRAP: length 10.8
  Top Layer w0.305: v2(25.01,29.81) 24.83,29.81 24.82,29.8 U3.5 ; v2(20.47,35.62) 20.47,35.2 21.2,34.48 21.2,33.75
  Bottom Layer w0.305: v2(25.01,29.81) 20.47,34.34 v2(20.47,35.62)
IO8_STRAP: length 6.7
  Top Layer w0.305: R12.2 33,20.85 31.71,20.85 31.51,21.04 31.51,22.15 32.74,23.38 33.2,23.38 U3.22
KEY1: length 30.1
  Top Layer w0.305: 46.85,14.47 v2(46.85,14.61) ; 46.85,14.47 43.62,14.47 42.85,13.7 ; 46.85,14.47 46.85,13.7 ; U3.19 30.8,23.38 30.95,23.23 v2(31.67,23.23)
  Bottom Layer w0.305: v2(46.85,14.61) 46.85,15.65 35.27,27.23 34.76,27.23 33.42,25.89 33.42,24.99 v2(31.67,23.23)
KEY2: length 20.2
  Top Layer w0.305: 46.85,23.6 46.13,23.6 45.36,24.36 43.81,24.36 43.57,24.12 43.57,23.6 v2(41.94,23.6) ; v2(32.54,25) 32.36,24.82 31.6,24.82 U3.20
  Bottom Layer w0.305: v2(41.94,23.6) 37.84,27.7 34.55,27.7 32.54,25.69 v2(32.54,25)
LED1: length 5.1
  Top Layer w0.305: 41.9,10.07 41.9,11.29 43.63,13.02 43.63,13.7 R1.2
LED2: length 5.2
  Top Layer w0.305: R2.2 44.35,22.85 42.49,20.99 41.9,20.99 41.9,19.77
PWM_IN: length 28.2
  Top Layer w0.305: v2(29.85,23.23) 30,23.38 U3.18 ; R5.1 11.9,30.47 11.38,30.47 11.14,30.71 11.14,32.36 11.9,33.12 11.9,33.56 ; 11.9,33.56 R6.1 ; 11.9,33.56 v2(18.89,33.56)
  Bottom Layer w0.305: v2(29.85,23.23) 19.52,33.56 v2(18.89,33.56)
SERVO_SIG: length 9.2
  Top Layer w0.305: R5.2 12.66,30.49 12.66,29.22 12.47,29.02 11.33,29.02 10.45,29.9 10.45,32.09 J3.3
UART_RX: length 15.8
  Top Layer w0.305: U3.30 36.62,29 36.65,28.97 v2(44.56,28.97)
  Bottom Layer w0.305: J6.4 48.78,28.97 v2(44.56,28.97)
UART_TX: length 13
  Top Layer w0.229: v2(45.05,29.61) 36.77,29.61 36.58,29.8 U3.31
  Bottom Layer w0.305: v2(45.05,29.61) 46.88,29.61 J6.3
USB_DN: length 23.3
  Top Layer w0.229: 34.94,25.52 35.22,25.8 35.9,25.8
  Top Layer w0.3: 29.22,8.28 29.22,7.41 USB1.B7
  Top Layer w0.305: 29.22,8.28 29.28,8.34 30.25,8.34 ; 30.25,7.37 30.25,8.34 ; 30.25,8.34 v2(30.25,8.53) ; v2(34.65,25.52) 34.94,25.52
  Bottom Layer w0.305: v2(34.65,25.52) 34.65,12.92 v2(30.25,8.53)
USB_DP: length 26.3
  Top Layer w0.305: 30.75,6.41 30.75,6.4 v2(30.92,6.23) ; 30.75,6.41 30.75,7.37 ; 30.75,6.41 29.75,6.41 29.75,7.37 ; v2(35.01,26.6) U3.27
  Bottom Layer w0.305: v2(30.92,6.23) 35.26,10.57 35.26,26.34 v2(35.01,26.6)

## Copper pours and planes (outline as drawn; the poured copper is in the pictures)
GND on Top Layer: 0.4,0.4 0.4,39.6 59.6,39.6 59.6,0.4
GND on Bottom Layer: 0.4,0.4 0.4,39.6 59.6,39.6 59.6,0.4
